# EasyEDA Pro project fei1554973967-sw3538-dff8db20.epro, schematic 底板_1
Board Name: 底板带串口; Create Date: 2025-04-27; Page Name: P1; Project Name: SW3538彩屏桌面充电站; Schematic Name: 底板_1; Update Date: 2025-06-13; Company: 嘉立创EDA; Page Size: A4; Version: V1.0
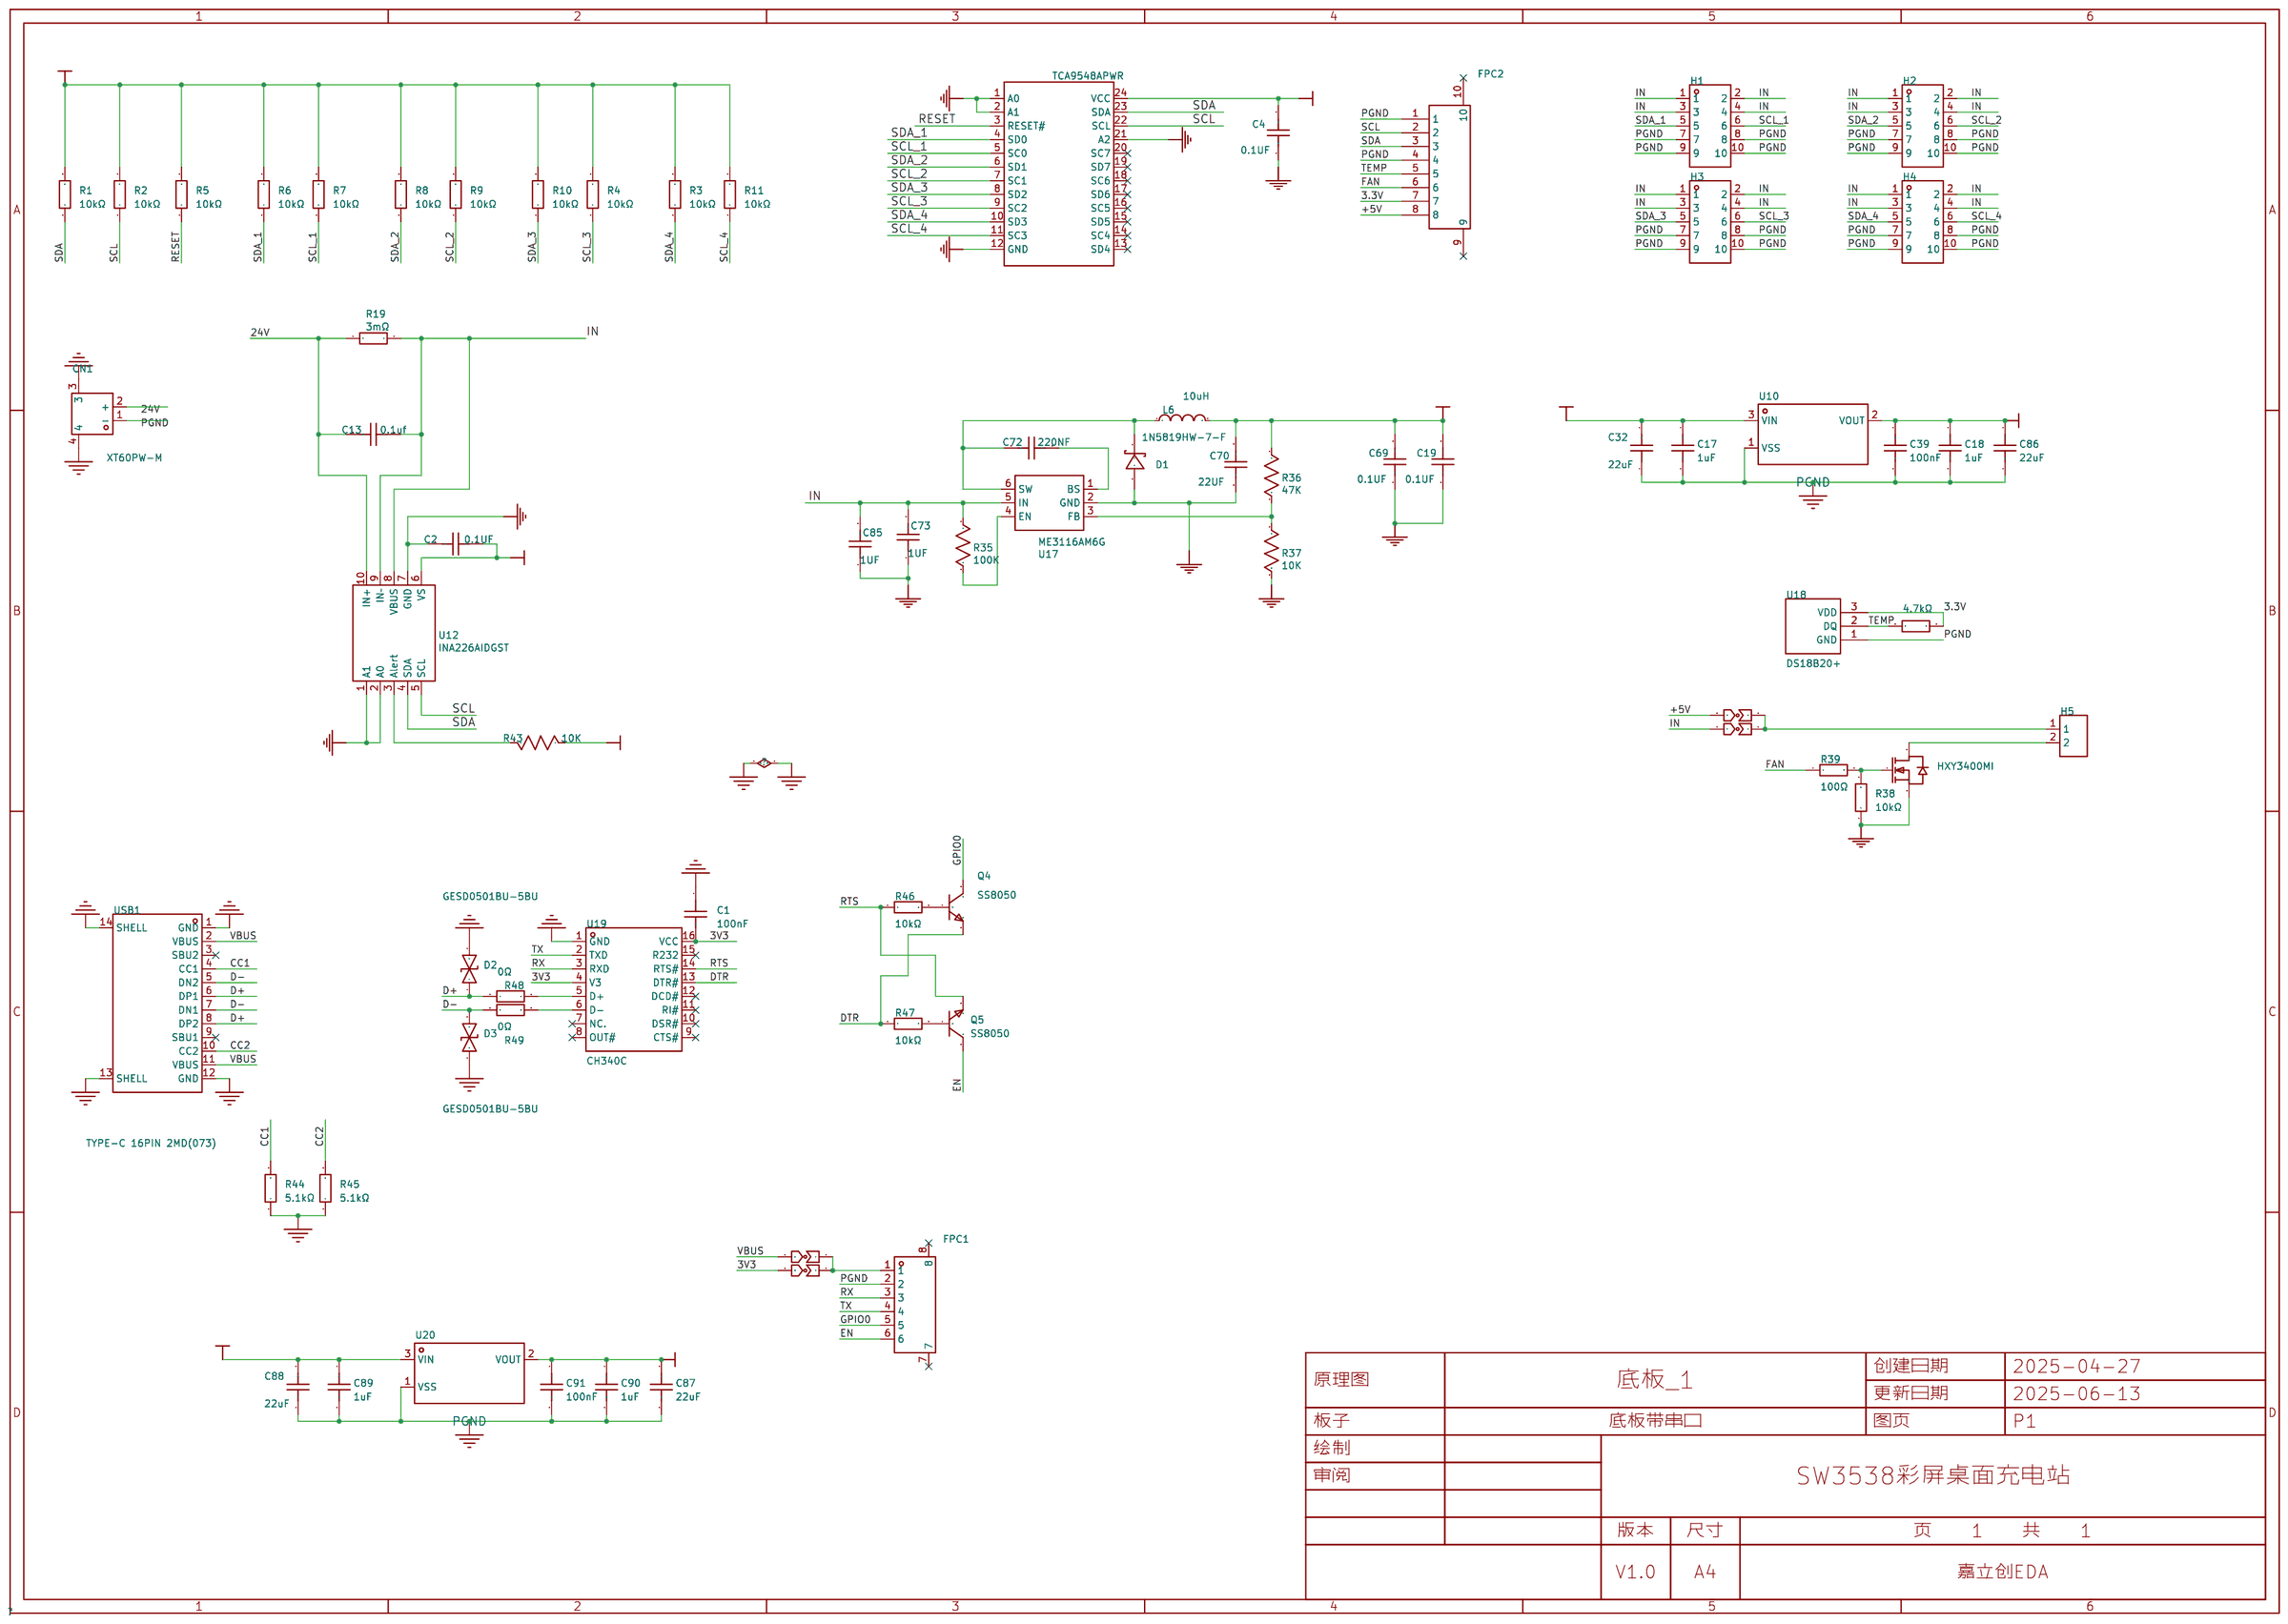
[diagram p1: schematic sheet]

## Parts
C1  100nF  [C0603]
C2  0.1UF  [C0603]
C4  0.1UF  [C0603]
C13  0.1uf  [C0603]
C17  1uF  [C0603]
C18  1uF  [C0603]
C19  0.1UF  [C0603]
C32  22uF  [c0603]
C39  100nF  [c0603]
C69  0.1UF  [C0603]
C70  22UF  [C0603]
C72  220NF  [C0603]
C73  1UF  [C0603]
C85  1UF  [C0603]
C86  22uF  [c0603]
C87  22uF  [c0603]
C88  22uF  [c0603]
C89  1uF  [C0603]
C90  1uF  [C0603]
C91  100nF  [c0603]
CN1  XT60PW-M  [CONN-TH_XT60PW-M]
D1  1N5819HW-7-F  [SOD-123_L2.7-W1.6-LS3.7-RD]
D2  GESD0501BU-5BU  [DFN1006-BI]
D3  GESD0501BU-5BU  [DFN1006-BI]
FPC1  0.5-6PQFHY-H1.0 119  [FPC-SMD_6P-P0.50_SHOU-HAN_0.5-6PQFHY-H1.0]
FPC2  AFA07-S08FCA-00  [FPC-SMD_8P-P1.00_LCS-XJ]
H1  PM254-2-05-W-8.5  [HDR-TH_10P-P2.54-H-F-R2-C5-W8.5]
H2  PM254-2-05-W-8.5  [HDR-TH_10P-P2.54-H-F-R2-C5-W8.5]
H3  PM254-2-05-W-8.5  [HDR-TH_10P-P2.54-H-F-R2-C5-W8.5]
H4  PM254-2-05-W-8.5  [HDR-TH_10P-P2.54-H-F-R2-C5-W8.5]
H5  PZ254V-11-02P  [HDR-TH_2P-P2.54-V-M]
L6  10uH  [IND-SMD_L3.5-W3.0]
Q2  HXY3400MI  [SOT-23-3_L2.9-W1.6-P1.90-LS2.8-BL-A]
Q4  SS8050  [SOT-23-3_L2.9-W1.3-P1.90-LS2.4-BR]
Q5  SS8050  [SOT-23-3_L2.9-W1.3-P1.90-LS2.4-BR]
R1  10kΩ  [R0603]
R2  10kΩ  [R0603]
R3  10kΩ  [R0603]
R4  10kΩ  [R0603]
R5  10kΩ  [R0603]
R6  10kΩ  [R0603]
R7  10kΩ  [R0603]
R8  10kΩ  [R0603]
R9  10kΩ  [R0603]
R10  10kΩ  [R0603]
R11  10kΩ  [R0603]
R19  3mΩ  [R2512]
R35  100K  [R0603]
R36  47K  [R0603]
R37  10K  [R0603]
R38  10kΩ  [R0603]
R39  100Ω  [R0603]
R40  4.7kΩ  [R0603]
R43  10K  [R0603]
R44  5.1kΩ  [R0603]
R45  5.1kΩ  [R0603]
R46  10kΩ  [R0603]
R47  10kΩ  [R0603]
R48  0Ω  [R0603]
R49  0Ω  [R0603]
SC29  -  [短接点0402]
SC30  -  [短接点0402]
SC31  -  [短接点0402]
SC32  -  [短接点0402]
U2  TCA9548APWR  [TSSOP-24_L7.8-W4.4-P0.65-LS6.4-BL]
U10  ME6211A33M3G-N  [SOT-23-3_L2.9-W1.6-P1.90-LS2.8-BR]
U12  INA226AIDGST  [VSSOP-10_L3.0-W3.0-P0.50-LS4.9-BL]
U17  ME3116AM6G  [SOT-23-6_L2.9-W1.6-P0.95-LS2.8-BL_3]
U18  DS18B20+  [TO-92-3_L4.9-W3.7-P1.27-L]
U19  CH340C  [SOP-16_L10.0-W3.9-P1.27-LS6.0-BL]
U20  ME6211A33M3G-N  [SOT-23-3_L2.9-W1.6-P1.90-LS2.8-BR]
USB1  TYPE-C 16PIN 2MD(073)  [USB-C-SMD_TYPE-C-6PIN-2MD-073]

## Library data of the parts
C1 = CGA0603X7R104K500JT: 容值:100nF;精度:±10%;额定电压:50V;温度系数:X7R;; LCSC Part Name: 100nF ±10% 50V; Supplier Part: C6119867; Manufacturer: HRE(芯声); Supplier Footprint: 0603; JLCPCB Part Class: 扩展库; Datasheet: https://atta.szlcsc.com/upload/public/pdf/source/20250103/C44077DA9E7B3EFAE02F22B6D3D1CBC9.pdf; Supplier: LCSC; Tolerance: ±10%; Voltage Rating: 50V; Temperature Coefficient: X7R; Voltage Rated: 50V
C2 C4 C19 C69 = 0.1UF
C13 = 0.1uf
C17 C18 C89 C90 = CL10A105KB8NNNC: 容值:1uF;精度:±10%;额定电压:50V;材质(温度系数):X5R;; LCSC Part Name: 1uF ±10% 50V; Supplier Part: C15849; Manufacturer: SAMSUNG(三星); Supplier Footprint: 0603; JLCPCB Part Class: Basic Part; Datasheet: https://atta.szlcsc.com/upload/public/pdf/source/20160218/1457707763339.pdf; Supplier: LCSC; Tolerance: ±10%; Voltage Rated: 50V; Temperature Coefficient: X5R; Check: true
C32 C86-C88 = CL10A226MQ8NRNC: 容值:22uF;精度:±20%;额定电压:6.3V;材质(温度系数):X5R;; LCSC Part Name: 22uF ±20% 6.3V; Supplier Part: C59461; Manufacturer: SAMSUNG(三星); Supplier Footprint: 0603; JLCPCB Part Class: Basic Part; Datasheet: https://atta.szlcsc.com/upload/public/pdf/source/20160218/1457707763339.pdf; Supplier: LCSC; Tolerance: ±20%; Voltage Rated: 6.3V; Temperature Coefficient: X5R; Check: true
C39 C91 = CC0603KRX7R9BB104: 容值:100nF;精度:±10%;额定电压:50V;材质(温度系数):X7R;; LCSC Part Name: 100nF ±10% 50V; Supplier Part: C14663; Manufacturer: YAGEO(国巨); Supplier Footprint: 0603; JLCPCB Part Class: Basic Part; Datasheet: https://atta.szlcsc.com/upload/public/pdf/source/20180910/C282072_33301C7F631E79921B82A8DAC6BCC5B3.pdf; Supplier: LCSC; Tolerance: ±10%; Voltage Rated: 50V; Temperature Coefficient: X7R; Check: true
C70 = 22UF
C72 = 220NF
C73 C85 = 1UF
CN1 = XT60PW-M: 类别:-;类型1:-;; LCSC Part Name: AMASS(艾迈斯)航模插头xt60连接器150公母对接pw锂电池公头 板插卧式XT60PW-M; Supplier Part: C98732; Manufacturer: AMASS(艾迈斯); JLCPCB Part Class: 扩展库; Datasheet: https://atta.szlcsc.com/upload/public/pdf/source/20240118/44A3DCFF53BE25DC65378AFFB21277A4.pdf; Supplier: LCSC; Brand: 艾迈斯; Type: 卧式插头; Colour: 黄色; InterfaceType: 公头
D1 = 1N5819HW-7-F: 正向压降(Vf):450mV@1A;直流反向耐压(Vr):40V;整流电流:1A;; LCSC Part Name: 电压:40V 电流:1A; Supplier Part: C82544; Manufacturer: DIODES(美台); Supplier Footprint: SOD-123; JLCPCB Part Class: 扩展库; Datasheet: https://atta.szlcsc.com/upload/public/pdf/source/20161024/1477288459223.pdf; Supplier: LCSC; Forward Voltage (Vf@If): 450mV@1A; Reverse Voltage (Vr): 40V; Rectified Current: 1A; Reverse Leakage Current (Ir): 1mA@40V
D2 D3 = GESD0501BU-5BU: 反向截止电压(Vrwm):5V;钳位电压:13V;峰值脉冲功率(Ppp):100W;击穿电压:6V;; Supplier Part: C5365358; Manufacturer: JUXING(钜兴); Supplier Footprint: DFN1006; JLCPCB Part Class: 扩展库; Datasheet: https://atta.szlcsc.com/upload/public/pdf/source/20230531/6F6D081276C35ECA44A00A2D81057797.pdf; Supplier: LCSC; Reverse Stand-Off Voltage (Vrwm): 5V; Clamping Voltage: 13V; Peak Pulse Power Dissipation (Ppp): 100W; Voltage - Breakdown: 6V; Reverse Leakage Current (Ir): 100nA; Type: ESD
FPC1 = 0.5-6PQFHY-H1.0 119: 锁定特性:翻盖式;触点类型:双侧触点上下接;触点数量:6P;间距:0.5mm;安装类型:卧贴;工作温度范围:-55℃~+85℃;; LCSC Part Name: 翻盖式 双侧触点上下接 P数:6P 间距:0.5mm; Supplier Part: C2858296; Manufacturer: SHOU HAN(首韩); Supplier Footprint: SMD,P=0.5mm,卧贴; JLCPCB Part Class: 扩展库; Supplier: LCSC; Locking Feature: 翻盖式; Contact Type: 双侧触点上下接; Number of Contacts: 6P; Pitch: 0.5mm; Mounting Type: 卧贴; FFC, FCB Thickness: 0.3mm; Height Above Board: 1mm; Contact Material: 磷青铜; Contact Plating: 金; Operating Temperature Range: -55℃~+85℃
FPC2 = AFA07-S08FCA-00: 锁定特性:抽屉式;触点类型:下接;触点数量:8P;间距:1mm;安装类型:卧贴;; LCSC Part Name: 间距:1mm P数:8P 抽屉式 下接; Supplier Part: C262714; Manufacturer: JS(钜硕电子); Supplier Footprint: SMD,P=1mm,卧贴; JLCPCB Part Class: 扩展库; Datasheet: https://atta.szlcsc.com/upload/public/pdf/source/20191217/C262716_30B15E9A77BFCA4A54741C92DB3BE8CC.pdf; Supplier: LCSC; Locking Feature: 抽屉式; Contact Type: 下接; Number of Contacts: 8P; Pitch: 1mm; Mounting Type: 卧贴; FFC, FCB Thickness: 0.3mm; Height Above Board: 2.5mm
H1-H4 = PM254-2-05-W-8.5: 插孔结构:2x5P;间距:2.54mm;行距:2.54mm;圆孔/方孔:方孔;安装类型:弯插;排数:双排;总孔位数:10P;额定电流:3A;额定电压:-;插孔方向:侧面;塑高:8.5mm;触头材质:铜合金;工作温度范围:-40℃~+105℃;焊接温度(最大值):260℃@5S;; LCSC Part Name: 2x5P 间距:2.54mm 弯插; Supplier Part: C2897425; Manufacturer: HCTL(华灿天禄); Supplier Footprint: 弯插,P=2.54mm; JLCPCB Part Class: 扩展库; Datasheet: https://atta.szlcsc.com/upload/public/pdf/source/20230609/283C0D22EF4E6FFE03D5A855876981ED.pdf; Supplier: LCSC; Holes Structure: 2x5P; Pitch: 2.54mm; Row Spacing: 2.54mm; Circular Hole / Square Hole: 方孔; Mounting Type: 弯插; Number of Rows: 双排; Number of Holes: 10P; Current Rating (Max): 3A; Holes Direction: 侧面; Insulation Height: 8.5mm; Contact Material: 铜合金; Operating Temperature Range: -40℃~+105℃; Soldering Temperature(Max): 260℃@5S
H5 = PZ254V-11-02P: 插针结构:1x2P;间距:2.54mm;行距:-;圆针/方针:方针;安装方式:直插;排数:单排;总PIN位数:2P;额定电流:-;额定电压:-;配合针长度:6mm;塑高:2.5mm;端接针长度:3mm;触头材质:黄铜;触头镀层:-;工作温度:-40℃~+105℃;颜色:黑色;; LCSC Part Name: 1x2P 间距:2.54mm 方针 直插; Supplier Part: C492401; Manufacturer: XFCN(兴飞); Supplier Footprint: 插件,P=2.54mm; JLCPCB Part Class: 扩展库; Datasheet: https://atta.szlcsc.com/upload/public/pdf/source/20200309/C492401_A812433581A9B211A7FFA413ADDFF0E5.pdf; Supplier: LCSC; Pin Structure: 1x2P; Pitch: 2.54mm; Circluar Pins/Square Pins: 方针; Mounting Type: 直插; Number of Rows: 单排; Number of Pins: 2P; Length of Mating Pin: 6mm; Insulation Height: 2.5mm; Length of End Connection Pin: 3mm; Contact Material: 黄铜; Operating Temperature: -40℃~+105℃; Color: 黑色
L6 = CD32YP0302-100M: 电感值:10uH;精度:±20%;额定电流:1A;; LCSC Part Name: 10uH ±20%; Supplier Part: C492261; Manufacturer: YJYCOIN(益嘉源); Supplier Footprint: SMD,3.5x3x2.1mm; JLCPCB Part Class: Extended Part; Datasheet: https://atta.szlcsc.com/upload/public/pdf/source/20200311/C492266_3C4DCA97B8B94D4CA8DBD234C7C1D8A4.pdf; Supplier: LCSC; Tolerance: ±20%; Rated Current: 1A; DC Resistance (DCR): 342mΩ
Q2 = HXY3400MI: 类型:1个N沟道;漏源电压(Vdss):30V;连续漏极电流(Id):5.8A;导通电阻(RDS(on)):34mΩ@4.5V,5A;耗散功率(Pd):1.4W;阈值电压(Vgs(th)):900mV;; LCSC Part Name: N沟道增强型MOSFET,电流:5.8A,耐压:30V; Supplier Part: C3033394; Manufacturer: HXY MOSFET(华轩阳电子); Supplier Footprint: SOT-23-3L; JLCPCB Part Class: 扩展库; Datasheet: https://atta.szlcsc.com/upload/public/pdf/source/20221215/6C8D29E061861687C40E99BCAB481A60.pdf; Supplier: LCSC; Type: 1个N沟道; Drain to Source Voltage: 30V; Current - Continuous Drain(Id): 5.8A; RDS(on): 34mΩ@4.5V,5A; Pd - Power Dissipation: 1.4W; Gate Threshold Voltage (Vgs(th)@Id): 900mV; Gate Charge(Qg): 10nC; Input Capacitance(Ciss@Vds): 825pF; Reverse Transfer Capacitance (Crss@Vds): 78pF; Operating Temperature: -55℃~+150℃
Q4 Q5 = SS8050_C7420370: 晶体管类型:NPN;集电极电流(Ic):1.5A;集射极击穿电压(Vceo):25V;耗散功率(Pd):300mW;直流电流增益(hFE):120@100mA,1.0V;; LCSC Part Name: H档 200-350; Supplier Part: C7420370; Manufacturer: 宏嘉诚; Supplier Footprint: SOT-23; JLCPCB Part Class: 扩展库; Datasheet: https://atta.szlcsc.com/upload/public/pdf/source/20250205/5DB94E86981B5B1A1866D18E379C0D4F.pdf; Supplier: LCSC; type: NPN; Current - Collector(Ic): 1.5A; Collector - Emitter Voltage VCEO: 25V; Pd - Power Dissipation: 300mW; DC Current Gain: 120@100mA,1.0V; Transition frequency(fT): 100MHz; Current - Collector Cutoff: 100nA; Vce Saturation(VCE(sat)): 500mV; Operating Temperature: -55℃~+150℃
R1-R11 R46 R47 = 0603WAF1002T5E: 电阻类型:厚膜电阻;阻值:10kΩ;精度:±1%;功率:100mW;最大工作电压:75V;温度系数:±100ppm/℃;; LCSC Part Name: 厚膜电阻 10kΩ ±1% 100mW; Supplier Part: C25804; Manufacturer: UNI-ROYAL(厚声); Supplier Footprint: 0603; JLCPCB Part Class: 基础库; Datasheet: https://atta.szlcsc.com/upload/public/pdf/source/20200306/C422600_1E6D84923E4A46A82E41ADD87F860B5C.pdf; Supplier: LCSC; Type: 厚膜电阻; Tolerance: ±1%; Power(Watts): 100mW; Overload Voltage (Max): 75V; Temperature Coefficient: ±100ppm/℃; Operating Temperature Range: -55℃~+155℃
R19 = HoYLR2512-3W-3mR-1%: 电阻类型:采样电阻;阻值:3mΩ;精度:±1%;功率:3W;安装方式:贴片;; LCSC Part Name: 3mΩ ±1% 3W; Supplier Part: C5375459; Manufacturer: Milliohm(毫欧); Supplier Footprint: 2512; JLCPCB Part Class: Extended Part; Datasheet: https://atta.szlcsc.com/upload/public/pdf/source/20230410/281FB57F2A31C64FD07DBC5FCC932F0E.pdf; Supplier: LCSC; Type: 采样电阻; Tolerance: ±1%; Power(Watts): 3W; Mounting Sytle: 贴片
R35 = 100K
R36 = 47K
R37 R43 = 10K
R38 = RC0603FR-0710KL: 电阻类型:厚膜电阻;阻值:10kΩ;精度:±1%;功率:100mW;最大工作电压:75V;温度系数:±100ppm/℃;; LCSC Part Name: 厚膜电阻 10kΩ ±1% 100mW; Supplier Part: C98220; Manufacturer: YAGEO(国巨); Supplier Footprint: 0603; JLCPCB Part Class: 扩展库; Datasheet: https://atta.szlcsc.com/upload/public/pdf/source/20180927/C295883_E8D83085EA81BD7DE0B2B681138C15EE.pdf; Supplier: LCSC; Type: 厚膜电阻; Tolerance: ±1%; Power(Watts): 100mW; Overload Voltage (Max): 75V; Temperature Coefficient: ±100ppm/℃; Operating Temperature Range: -55℃~+155℃
R39 = 0603WAF1000T5E: 电阻类型:厚膜电阻;阻值:100Ω;精度:±1%;功率:100mW;最大工作电压:75V;温度系数:±200ppm/℃;; LCSC Part Name: 100Ω ±1% 100mW 厚膜电阻; Supplier Part: C22775; Manufacturer: UNI-ROYAL(厚声); Supplier Footprint: 0603; JLCPCB Part Class: 基础库; Datasheet: https://atta.szlcsc.com/upload/public/pdf/source/20200306/C422600_1E6D84923E4A46A82E41ADD87F860B5C.pdf; Supplier: LCSC; Type: 厚膜电阻; Tolerance: ±1%; Power(Watts): 100mW; Overload Voltage (Max): 75V; Temperature Coefficient: ±200ppm/℃; Operating Temperature Range: -55℃~+155℃
R40 = RC0603FR-074K7L: 电阻类型:厚膜电阻;阻值:4.7kΩ;精度:±1%;功率:100mW;最大工作电压:75V;温度系数:±100ppm/℃;; LCSC Part Name: 厚膜电阻 4.7kΩ ±1% 100mW; Supplier Part: C99782; Manufacturer: YAGEO(国巨); Supplier Footprint: 0603; JLCPCB Part Class: 扩展库; Datasheet: https://atta.szlcsc.com/upload/public/pdf/source/20180224/C181757_15194369480721363983.pdf; Supplier: LCSC; Type: 厚膜电阻; Tolerance: ±1%; Power(Watts): 100mW; Overload Voltage (Max): 75V; Temperature Coefficient: ±100ppm/℃; Operating Temperature Range: -55℃~+155℃
R44 R45 = 0603WAF5101T5E: 电阻类型:厚膜电阻;阻值:5.1kΩ;精度:±1%;功率:100mW;最大工作电压:75V;温度系数:±100ppm/℃;; LCSC Part Name: 5.1kΩ ±1% 100mW 厚膜电阻; Supplier Part: C23186; Manufacturer: UNI-ROYAL(厚声); Supplier Footprint: 0603; JLCPCB Part Class: 基础库; Datasheet: https://atta.szlcsc.com/upload/public/pdf/source/20200306/C422600_1E6D84923E4A46A82E41ADD87F860B5C.pdf; Supplier: LCSC; Type: 厚膜电阻; Tolerance: ±1%; Power(Watts): 100mW; Overload Voltage (Max): 75V; Temperature Coefficient: ±100ppm/℃; Operating Temperature Range: -55℃~+155℃
R48 R49 = 0603WAF0000T5E: 电阻类型:厚膜电阻;阻值:0Ω;精度:±1%;功率:100mW;最大工作电压:75V;; LCSC Part Name: 0Ω ±1% 100mW 厚膜电阻; Supplier Part: C21189; Manufacturer: UNI-ROYAL(厚声); Supplier Footprint: 0603; JLCPCB Part Class: Basic Part; Datasheet: https://atta.szlcsc.com/upload/public/pdf/source/20200306/C422600_1E6D84923E4A46A82E41ADD87F860B5C.pdf; Supplier: LCSC; Type: 厚膜电阻; Tolerance: ±1%; Power(Watts): 100mW; Overload Voltage (Max): 75V; Operating Temperature Range: -55℃~+155℃
SC29-SC32 = 短接点0402: 焊上就完事了
U2 = TCA9548APWR: Supplier: LCSC; Manufacturer: TI(德州仪器); Supplier Part: C130026; JLCPCB Part Class: Extended Part
U10 U20 = ME6211A33M3G-N: 输出类型:固定;输出极性:正;最大输入电压:6V;输出电压:3.3V;输出电流:500mA;电源纹波抑制比(PSRR):70dB;; LCSC Part Name: 正 Vin=6V Vout=3.3V 500mA 70dB; Supplier Part: C168807; Manufacturer: MICRONE(南京微盟); Supplier Footprint: SOT-23; JLCPCB Part Class: 扩展库; Datasheet: https://atta.szlcsc.com/upload/public/pdf/source/20180224/C168807_15194366627921363679.pdf; Supplier: LCSC; Output Type: 固定; Output Polarity: 正; Number of Outputs: 1; Maximum Input Voltage: 6V; Output Voltage: 3.3V; Dropout Voltage: 260mV@(200mA); Output Current: 500mA; Power Supply Rejection Ratio (PSRR): 70dB
U12 = INA226AIDGST: Supplier: LCSC; Supplier Part: C2653870; Manufacturer: TI(德州仪器); JLCPCB Part Class: Extended Part
U17 = ME3116AM6G: Supplier: LCSC; Supplier Part: C427569; Manufacturer: null; JLCPCB Part Class: Extended Part
U18 = DS18B20+: 分辨率可编程设置的1-Wire数字温度计、通过最少的连线实现高精度温度测量，理想用于多传感器测量系统; LCSC Part Name: DS18B20; Supplier Part: C9753; Manufacturer: ADI(亚德诺)/MAXIM(美信); Supplier Footprint: TO-92; JLCPCB Part Class: 扩展库; Datasheet: https://atta.szlcsc.com/upload/public/pdf/source/20170713/C118507_1499918901893816791.pdf; Supplier: LCSC; Supply Voltage: 3V~5.5V
U19 = CH340C: 应用功能:收发器;接口协议:USB 2.0;数据速率:2Mbps;; LCSC Part Name: CH340C USB转串口芯片 CH340; Supplier Part: C84681; Manufacturer: WCH(南京沁恒); Supplier Footprint: SOP-16; JLCPCB Part Class: 扩展库; Datasheet: https://atta.szlcsc.com/upload/public/pdf/source/20240619/63986D8440D4E5267A77ACD891CC4DE3.pdf; Supplier: LCSC; Applications Function: 收发器; Protocol: USB 2.0; Supply Voltage: 3.3V；5V; Data Rate: 2Mbps
USB1 = TYPE-C 16PIN 2MD(073): 连接器类型:Type-C;标准:USB 3.1;公母:母;安装方式:卧贴;触点数量:16P;端口数量:1;额定电流 - 电源:5A;工作温度范围:-25℃~+85℃;; LCSC Part Name: Type-C 母 卧贴; Supplier Part: C2765186; Manufacturer: SHOU HAN(首韩); Supplier Footprint: SMD; JLCPCB Part Class: 扩展库; Datasheet: https://atta.szlcsc.com/upload/public/pdf/source/20211123/39B17C16241EAC15C5E277BDA434118E.pdf; Supplier: LCSC; Connector Type: Type-C; Standard: USB 3.1; Gender: 母; Mounting Style: 卧贴; Number of Contacts: 16P; Number of Ports: 1; Current Rating - Power (Max): 5A; Operating Temperature Range: -25℃~+85℃; Rated Voltage (Max): 5V; Connect-Disconnect Life: 5千次; Core Colour: 黑色

## Nets
3.3V: C2.2 C4.2 C18.1 C39.1 C86.2 FPC2.7 R1.2 R2.2 R3.2 R4.2 R5.2 R6.2 R7.2 R8.2 R9.2 R10.2 R11.2 R40.1 R43.1 U2.24(VCC) U10.2(VOUT) U12.6(VS) U18.3(VDD)
3V3: C1.2 C87.2 C90.1 C91.1 SC29.2 U19.4(V3) U19.16(VCC) U20.2(VOUT)
24V: C13.2 CN1.2(+) R19.1 U12.10(IN+)
+5V: C17.1 C19.2 C32.2 C69.2 C70.2 FPC2.8 L6.2 R36.1 SC32.2 U10.3(VIN)
GND: C1.1 C2.1 C4.1 C17.2 C18.2 C19.1 C32.1 C39.2 C69.1 C70.1 C73.1 C85.1 C86.1 C87.1 C88.1 C89.2 C90.2 C91.2 CN1.1(-) CN1.3 CN1.4 D1.2(A) D2.2 D3.1 FPC1.2 FPC2.1 FPC2.4 H1.7 H1.8 H1.9 H1.10 H2.7 H2.8 H2.9 H2.10 H3.7 H3.8 H3.9 H3.10 H4.7 H4.8 H4.9 H4.10 Q2.3(S) R37.2 R38.1 R44.1 R45.1 U2.1(A0) U2.2(A1) U2.12(GND) U2.21(A2) U10.1(VSS) U12.1(A1) U12.2(A0) U12.7(GND) U17.2(GND) U18.1(GND) U19.1(GND) U20.1(VSS) USB1.1(GND) USB1.12(GND) USB1.13(SHELL) USB1.14(SHELL)
VBUS: C88.2 C89.1 SC30.2 U20.3(VIN) USB1.2(VBUS) USB1.11(VBUS)
CC1: R44.2 USB1.4(CC1)
CC2: R45.2 USB1.10(CC2)
D+: D2.1 R48.1 USB1.6(DP1) USB1.8(DP2)
D-: D3.2 R49.1 USB1.5(DN2) USB1.7(DN1)
DTR: Q4.2(E) R47.1 U19.13(DTR#)
EN: FPC1.6 Q5.3(C)
FAN: FPC2.6 R39.1
GPIO0: FPC1.5 Q4.3(C)
IN: C13.1 C73.2 C85.2 H1.1 H1.2 H1.3 H1.4 H2.1 H2.2 H2.3 H2.4 H3.1 H3.2 H3.3 H3.4 H4.1 H4.2 H4.3 H4.4 R19.2 R35.1 SC31.2 U12.8(VBUS) U12.9(IN–) U17.5(IN)
RESET: R5.1 U2.3(RESET#)
RTS: Q5.2(E) R46.1 U19.14(RTS#)
RX: FPC1.3 U19.3(RXD)
SCL: FPC2.2 R2.1 U2.22(SCL) U12.5(SCL)
SCL_1: H1.6 R7.1 U2.5(SC0)
SCL_2: H2.6 R9.1 U2.7(SC1)
SCL_3: H3.6 R4.1 U2.9(SC2)
SCL_4: H4.6 R11.1 U2.11(SC3)
SDA: FPC2.3 R1.1 U2.23(SDA) U12.4(SDA)
SDA_1: H1.5 R6.1 U2.4(SD0)
SDA_2: H2.5 R8.1 U2.6(SD1)
SDA_3: H3.5 R10.1 U2.8(SD2)
SDA_4: H4.5 R3.1 U2.10(SD3)
TEMP: FPC2.5 R40.2 U18.2(DQ)
TX: FPC1.4 U19.2(TXD)
$1N2433: R36.2 R37.1 U17.3(FB)
$1N2434: C72.1 D1.1(K) L6.1 U17.6(SW)
$1N2440: R35.2 U17.4(EN)
$1N2441: C72.2 U17.1(BS)
$1N3750: Q2.1(G) R38.2 R39.2
$1N6746: R43.2 U12.3(Alert)
$1N6854: FPC1.1 SC29.1 SC30.1
$1N7284: Q4.1(B) R46.2
$1N7285: Q5.1(B) R47.2
$1N7617: R48.2 U19.5(D+)
$1N7618: R49.2 U19.6(D-)
Net-(H5-1): H5.1 SC31.1 SC32.1
Net-(H5-2): H5.2 Q2.2(D)

Not connected (* = marked no-connect by the designer): FPC1 7* 8*; FPC2 9* 10*; U2 13(SD4)* 14(SC4)* 15(SD5)* 16(SC5)* 17(SD6)* 18(SC6)* 19(SD7)* 20(SC7)*; U19 7(NC.)* 8(OUT#)* 9(CTS#)* 10(DSR#)* 11(RI#)* 12(DCD#)* 15(R232)*; USB1 3(SBU2)* 9(SBU1)*
